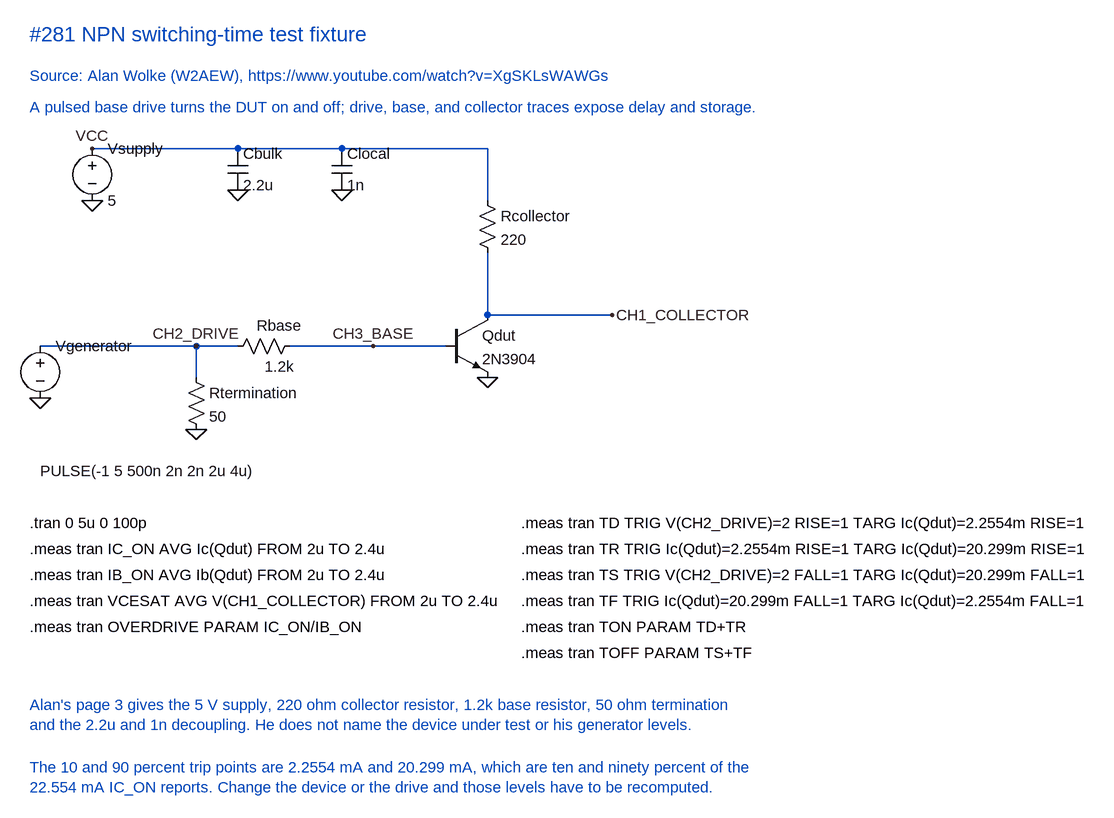
[diagram p0: schematic Transistor switching-time test fixture.asc]
Transistor switching-time test fixture.asc, the LTspice schematic file:
Version 4.1
SHEET 1 1200 920
WIRE 320 496 80 496
WIRE 384 496 320 496
WIRE 544 496 464 496
WIRE 704 496 544 496
WIRE 320 544 320 496
WIRE 960 448 768 448
WIRE 768 448 768 352
WIRE 768 272 768 192
WIRE 384 192 160 192
WIRE 544 192 384 192
WIRE 768 192 544 192
FLAG 160 192 VCC
FLAG 160 272 0
FLAG 80 576 0
FLAG 320 624 0
FLAG 768 544 0
FLAG 960 448 CH1_COLLECTOR
FLAG 320 496 CH2_DRIVE
FLAG 592 496 CH3_BASE
FLAG 384 256 0
FLAG 544 256 0
SYMBOL voltage 160 176 R0
SYMATTR InstName Vsupply
SYMATTR Value 5
SYMBOL voltage 80 480 R0
WINDOW 3 0 208 Left 2
SYMATTR InstName Vgenerator
SYMATTR Value PULSE(-1 5 500n 2n 2n 2u 4u)
SYMBOL res 304 528 R0
SYMATTR InstName Rtermination
SYMATTR Value 50
SYMBOL res 480 480 R90
WINDOW 0 0 32 VBottom 2
WINDOW 3 32 32 VTop 2
SYMATTR InstName Rbase
SYMATTR Value 1.2k
SYMBOL res 752 256 R0
SYMATTR InstName Rcollector
SYMATTR Value 220
SYMBOL npn 704 448 R0
SYMATTR InstName Qdut
SYMATTR Value 2N3904
SYMBOL cap 368 192 R0
SYMATTR InstName Cbulk
SYMATTR Value 2.2u
SYMBOL cap 528 192 R0
SYMATTR InstName Clocal
SYMATTR Value 1n
TEXT 64 16 Left 3 ;#281 NPN switching-time test fixture
TEXT 64 80 Left 2 ;Source: Alan Wolke (W2AEW), https://www.youtube.com/watch?v=XgSKLsWAWGs
TEXT 64 128 Left 2 ;A pulsed base drive turns the DUT on and off; drive, base, and collector traces expose delay and storage.
TEXT 64 768 Left 2 !.tran 0 5u 0 100p
TEXT 64 808 Left 2 !.meas tran IC_ON AVG Ic(Qdut) FROM 2u TO 2.4u
TEXT 64 848 Left 2 !.meas tran IB_ON AVG Ib(Qdut) FROM 2u TO 2.4u
TEXT 64 888 Left 2 !.meas tran VCESAT AVG V(CH1_COLLECTOR) FROM 2u TO 2.4u
TEXT 64 928 Left 2 !.meas tran OVERDRIVE PARAM IC_ON/IB_ON
TEXT 820 768 Left 2 !.meas tran TD TRIG V(CH2_DRIVE)=2 RISE=1 TARG Ic(Qdut)=2.2554m RISE=1
TEXT 820 808 Left 2 !.meas tran TR TRIG Ic(Qdut)=2.2554m RISE=1 TARG Ic(Qdut)=20.299m RISE=1
TEXT 820 848 Left 2 !.meas tran TS TRIG V(CH2_DRIVE)=2 FALL=1 TARG Ic(Qdut)=20.299m FALL=1
TEXT 820 888 Left 2 !.meas tran TF TRIG Ic(Qdut)=20.299m FALL=1 TARG Ic(Qdut)=2.2554m FALL=1
TEXT 820 928 Left 2 !.meas tran TON PARAM TD+TR
TEXT 820 968 Left 2 !.meas tran TOFF PARAM TS+TF
TEXT 64 1048 Left 2 ;Alan's page 3 gives the 5 V supply, 220 ohm collector resistor, 1.2k base resistor, 50 ohm termination\nand the 2.2u and 1n decoupling. He does not name the device under test or his generator levels.
TEXT 64 1144 Left 2 ;The 10 and 90 percent trip points are 2.2554 mA and 20.299 mA, which are ten and ninety percent of the\n22.554 mA IC_ON reports. Change the device or the drive and those levels have to be recomputed.

The netlist it stands for:
* Transistor switching-time test fixture.asc
Vsupply VCC 0 5
Vgenerator CH2_DRIVE 0 PULSE(-1 5 500n 2n 2n 2u 4u)
Rtermination CH2_DRIVE 0 50
Rbase CH3_BASE CH2_DRIVE 1.2k
Rcollector VCC CH1_COLLECTOR 220
Qdut CH1_COLLECTOR CH3_BASE 0 0 2N3904
Cbulk VCC 0 2.2u
Clocal VCC 0 1n
.model NPN NPN
.model PNP PNP
.lib standard.bjt
* #281 NPN switching-time test fixture
* Source: Alan Wolke (W2AEW), https://www.youtube.com/watch?v=XgSKLsWAWGs
* A pulsed base drive turns the DUT on and off; drive, base, and collector traces expose delay and storage.
.tran 0 5u 0 100p
.meas tran IC_ON AVG Ic(Qdut) FROM 2u TO 2.4u
.meas tran IB_ON AVG Ib(Qdut) FROM 2u TO 2.4u
.meas tran VCESAT AVG V(CH1_COLLECTOR) FROM 2u TO 2.4u
.meas tran OVERDRIVE PARAM IC_ON/IB_ON
.meas tran TD TRIG V(CH2_DRIVE)=2 RISE=1 TARG Ic(Qdut)=2.2554m RISE=1
.meas tran TR TRIG Ic(Qdut)=2.2554m RISE=1 TARG Ic(Qdut)=20.299m RISE=1
.meas tran TS TRIG V(CH2_DRIVE)=2 FALL=1 TARG Ic(Qdut)=20.299m FALL=1
.meas tran TF TRIG Ic(Qdut)=20.299m FALL=1 TARG Ic(Qdut)=2.2554m FALL=1
.meas tran TON PARAM TD+TR
.meas tran TOFF PARAM TS+TF
* Alan's page 3 gives the 5 V supply, 220 ohm collector resistor, 1.2k base resistor, 50 ohm termination
* and the 2.2u and 1n decoupling. He does not name the device under test or his generator levels.
* The 10 and 90 percent trip points are 2.2554 mA and 20.299 mA, which are ten and ninety percent of the
* 22.554 mA IC_ON reports. Change the device or the drive and those levels have to be recomputed.
.backanno
.end